# EAGLE design ce_cart (EAGLE 6.2)
Assembly variants: ACSI, SCSI
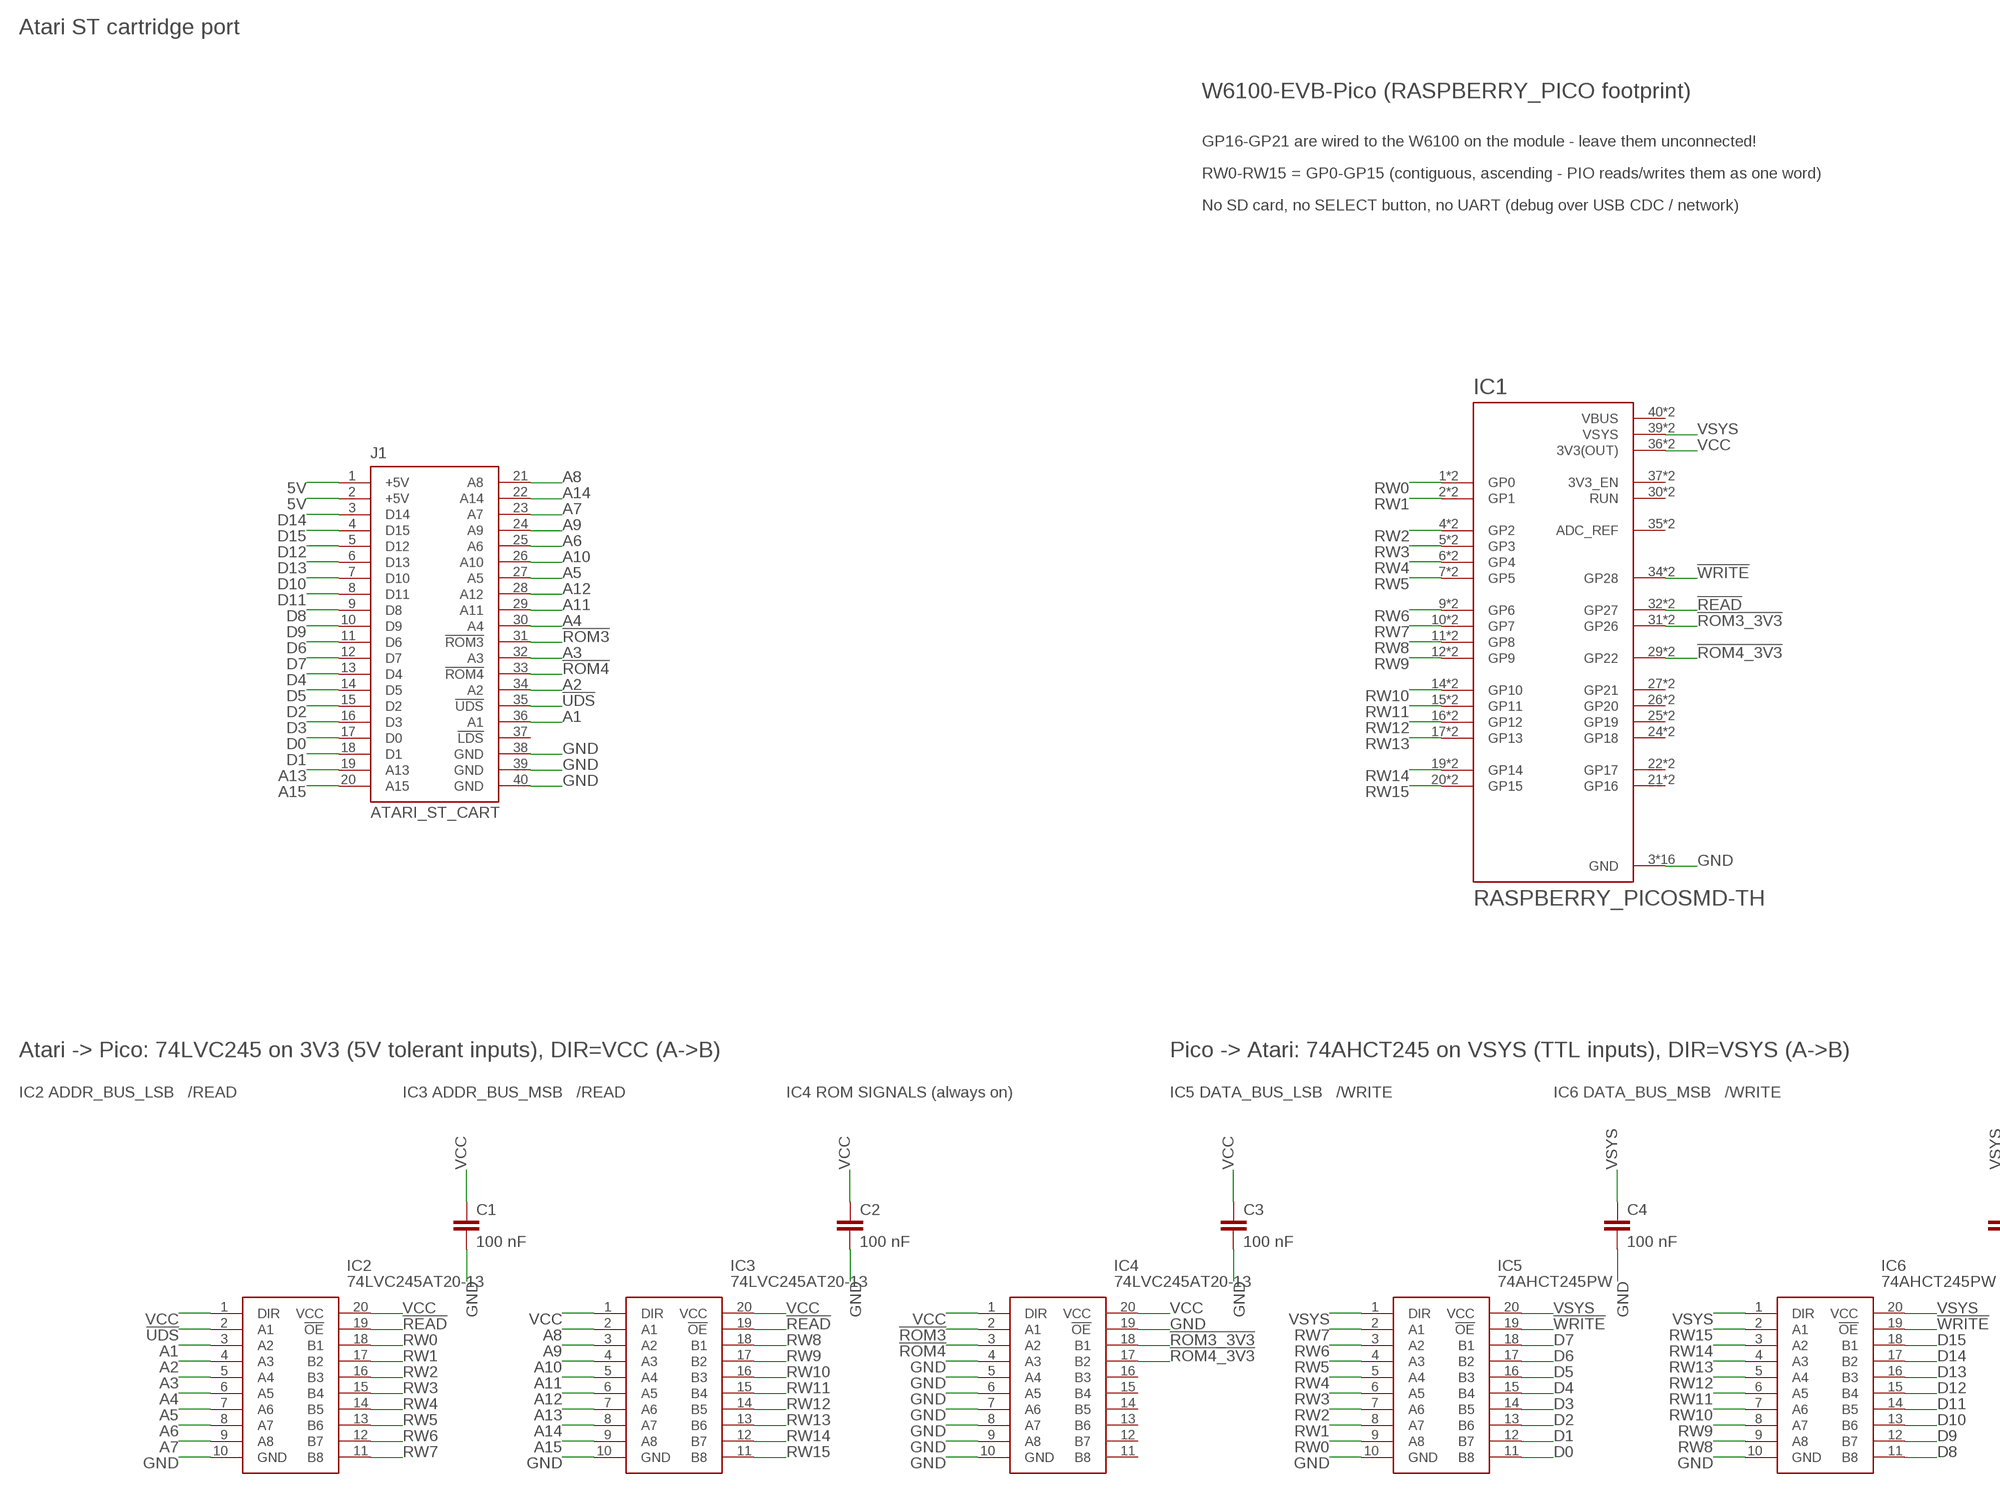
[diagram p0: schematic, sheet 1, part 1 of 2]
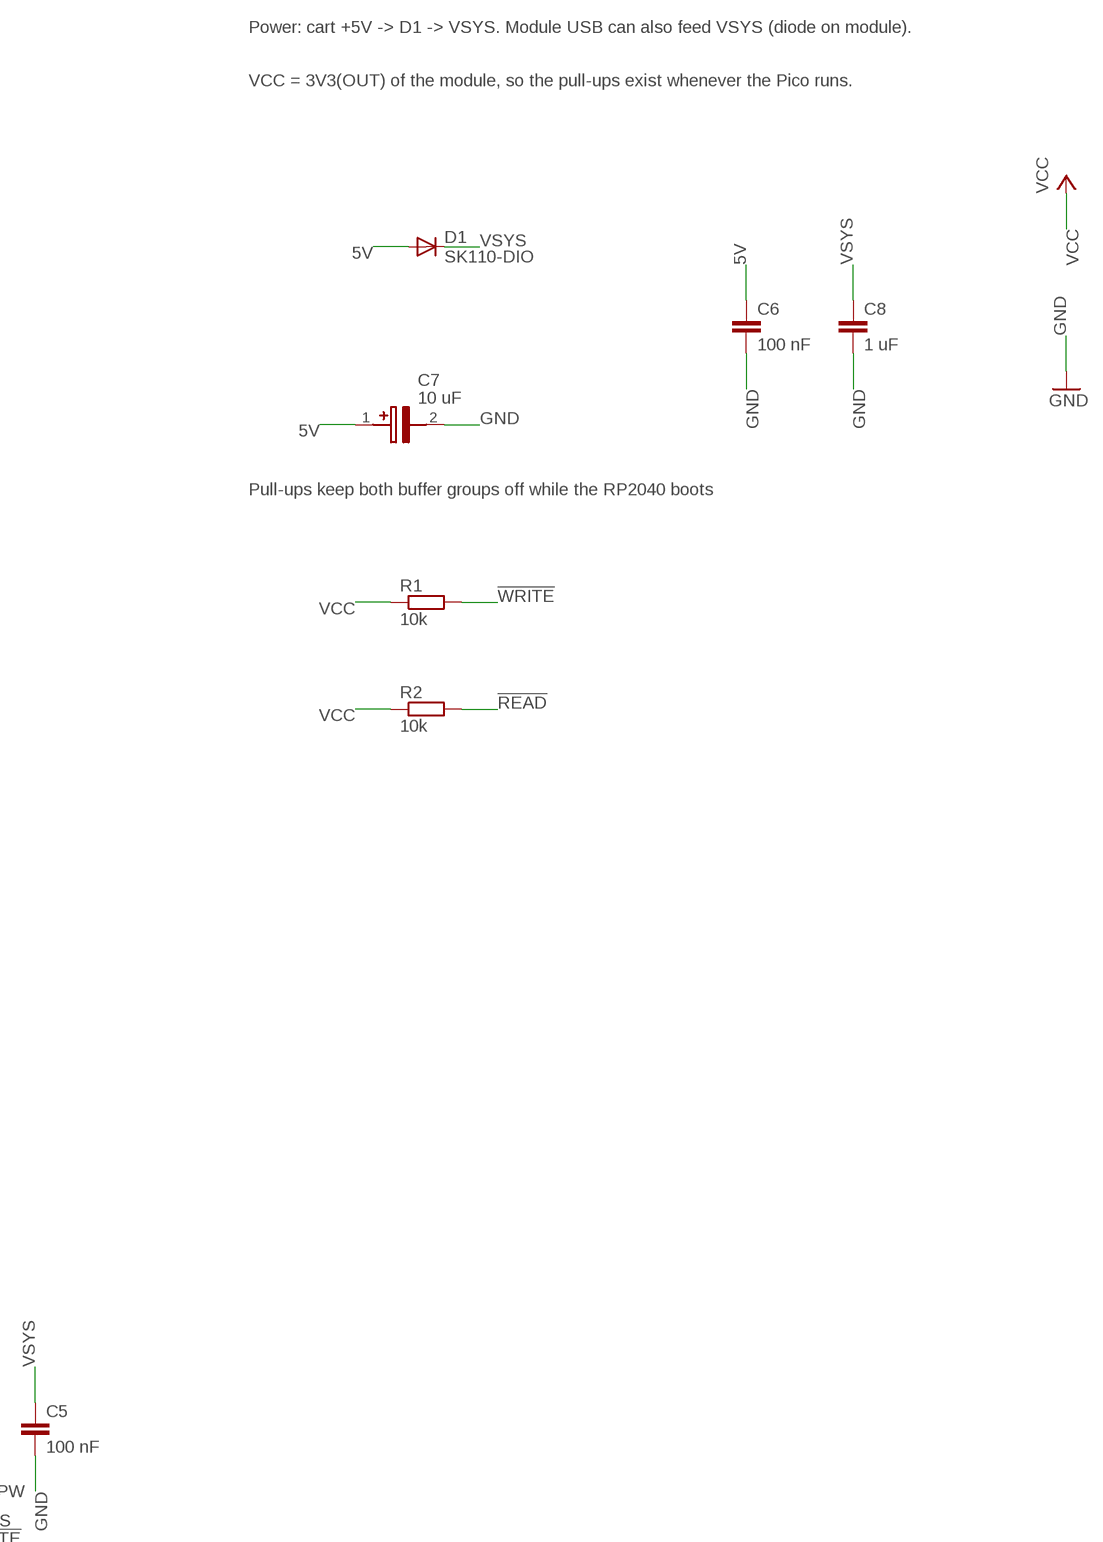
[diagram p1: schematic, sheet 1, part 2 of 2]

## Parts
C1  100 nF  C-EUC0603  [C0603]
C2  100 nF  C-EUC0603  [C0603]
C3  100 nF  C-EUC0603  [C0603]
C4  100 nF  C-EUC0603  [C0603]
C5  100 nF  C-EUC0603  [C0603]
C6  100 nF  C-EUC0603  [C0603]
C7  10 uF  293D106X9016B2TE3  [CAPPM3528X210N]
C8  1 uF  C-EUC0603  [C0603]
D1  SK110-DIO  DIODE-DO214AC  [DO214AC]
IC1  RASPBERRY_PICOSMD-TH  [PICO-PKG]
IC2  74LVC245AT20-13  [SOP65P640X120-20N]
IC3  74LVC245AT20-13  [SOP65P640X120-20N]
IC4  74LVC245AT20-13  [SOP65P640X120-20N]
IC5  74AHCT245PW  [SOP65P640X120-20N]
IC6  74AHCT245PW  [SOP65P640X120-20N]
J1  ATARI_ST_CART  ST_CART  [ST_CART_EDGE_2X20]
R1  10k  R-EU_R0603  [R0603]
R2  10k  R-EU_R0603  [R0603]

## Nets
5V: C6.1 C7.1(+) D1.A J1.1(+5V) J1.2(+5V)
!READ: IC1.32(GP27) IC1.P$32(GP27) IC2.19(!OE) IC3.19(!OE) R2.2
!ROM3: IC4.2(A1) J1.31(!ROM3)
!ROM3_3V3: IC1.31(GP26) IC1.P$31(GP26) IC4.18(B1)
!ROM4: IC4.3(A2) J1.33(!ROM4)
!ROM4_3V3: IC1.29(GP22) IC1.P$29(GP22) IC4.17(B2)
!UDS: IC2.2(A1) J1.35(!UDS)
!WRITE: IC1.34(GP28) IC1.P$34(GP28) IC5.19(!OE) IC6.19(!OE) R1.2
A1: IC2.3(A2) J1.36(A1)
A2: IC2.4(A3) J1.34(A2)
A3: IC2.5(A4) J1.32(A3)
A4: IC2.6(A5) J1.30(A4)
A5: IC2.7(A6) J1.27(A5)
A6: IC2.8(A7) J1.25(A6)
A7: IC2.9(A8) J1.23(A7)
A8: IC3.2(A1) J1.21(A8)
A9: IC3.3(A2) J1.24(A9)
A10: IC3.4(A3) J1.26(A10)
A11: IC3.5(A4) J1.29(A11)
A12: IC3.6(A5) J1.28(A12)
A13: IC3.7(A6) J1.19(A13)
A14: IC3.8(A7) J1.22(A14)
A15: IC3.9(A8) J1.20(A15)
D0: IC5.11(B8) J1.17(D0)
D1: IC5.12(B7) J1.18(D1)
D2: IC5.13(B6) J1.15(D2)
D3: IC5.14(B5) J1.16(D3)
D4: IC5.15(B4) J1.13(D4)
D5: IC5.16(B3) J1.14(D5)
D6: IC5.17(B2) J1.11(D6)
D7: IC5.18(B1) J1.12(D7)
D8: IC6.11(B8) J1.9(D8)
D9: IC6.12(B7) J1.10(D9)
D10: IC6.13(B6) J1.7(D10)
D11: IC6.14(B5) J1.8(D11)
D12: IC6.15(B4) J1.5(D12)
D13: IC6.16(B3) J1.6(D13)
D14: IC6.17(B2) J1.3(D14)
D15: IC6.18(B1) J1.4(D15)
GND: C1.2 C2.2 C3.2 C4.2 C5.2 C6.2 C7.2(-) C8.2 IC1.3(GND) IC1.8(GND) IC1.13(GND) IC1.18(GND) IC1.23(GND) IC1.28(GND) IC1.33(GND) IC1.38(GND) IC1.P$3(GND) IC1.P$8(GND) IC1.P$13(GND) IC1.P$18(GND) IC1.P$23(GND) IC1.P$28(GND) IC1.P$33(GND) IC1.P$38(GND) IC2.10(GND) IC3.10(GND) IC4.4(A3) IC4.5(A4) IC4.6(A5) IC4.7(A6) IC4.8(A7) IC4.9(A8) IC4.10(GND) IC4.19(!OE) IC5.10(GND) IC6.10(GND) J1.38(GND) J1.39(GND) J1.40(GND)
RW0: IC1.1(GP0) IC1.P$1(GP0) IC2.18(B1) IC5.9(A8)
RW1: IC1.2(GP1) IC1.P$2(GP1) IC2.17(B2) IC5.8(A7)
RW2: IC1.4(GP2) IC1.P$4(GP2) IC2.16(B3) IC5.7(A6)
RW3: IC1.5(GP3) IC1.P$5(GP3) IC2.15(B4) IC5.6(A5)
RW4: IC1.6(GP4) IC1.P$6(GP4) IC2.14(B5) IC5.5(A4)
RW5: IC1.7(GP5) IC1.P$7(GP5) IC2.13(B6) IC5.4(A3)
RW6: IC1.9(GP6) IC1.P$9(GP6) IC2.12(B7) IC5.3(A2)
RW7: IC1.10(GP7) IC1.P$10(GP7) IC2.11(B8) IC5.2(A1)
RW8: IC1.11(GP8) IC1.P$11(GP8) IC3.18(B1) IC6.9(A8)
RW9: IC1.12(GP9) IC1.P$12(GP9) IC3.17(B2) IC6.8(A7)
RW10: IC1.14(GP10) IC1.P$14(GP10) IC3.16(B3) IC6.7(A6)
RW11: IC1.15(GP11) IC1.P$15(GP11) IC3.15(B4) IC6.6(A5)
RW12: IC1.16(GP12) IC1.P$16(GP12) IC3.14(B5) IC6.5(A4)
RW13: IC1.17(GP13) IC1.P$17(GP13) IC3.13(B6) IC6.4(A3)
RW14: IC1.19(GP14) IC1.P$19(GP14) IC3.12(B7) IC6.3(A2)
RW15: IC1.20(GP15) IC1.P$20(GP15) IC3.11(B8) IC6.2(A1)
VCC: C1.1 C2.1 C3.1 IC1.36(3V3(OUT)) IC1.P$36(3V3(OUT)) IC2.1(DIR) IC2.20(VCC) IC3.1(DIR) IC3.20(VCC) IC4.1(DIR) IC4.20(VCC) R1.1 R2.1
VSYS: C4.1 C5.1 C8.1 D1.C IC1.39(VSYS) IC1.P$39(VSYS) IC5.1(DIR) IC5.20(VCC) IC6.1(DIR) IC6.20(VCC)
Unconnected: IC1.21(GP16) IC1.22(GP17) IC1.24(GP18) IC1.25(GP19) IC1.26(GP20) IC1.27(GP21) IC1.30(RUN) IC1.35(ADC_REF) IC1.37(3V3_EN) IC1.P$21(GP16) IC1.P$22(GP17) IC1.P$24(GP18) IC1.P$25(GP19) IC1.P$26(GP20) IC1.P$27(GP21) IC1.P$30(RUN) IC1.P$35(ADC_REF) IC1.P$37(3V3_EN) IC4.11(B8) IC4.12(B7) IC4.13(B6) IC4.14(B5) IC4.15(B4) IC4.16(B3) J1.37(!LDS)

## Notes on the sheet
- CE ROM port board - SidecarT-style shared bus, W6100-EVB-Pico | Power: cart +5V -> D1 -> VSYS. Module USB can also feed VSYS (diode on module).
- VCC = 3V3(OUT) of the module, so the pull-ups exist whenever the Pico runs.
- Atari ST cartridge port
- W6100-EVB-Pico (RASPBERRY_PICO footprint)
- GP16-GP21 are wired to the W6100 on the module - leave them unconnected!
- RW0-RW15 = GP0-GP15 (contiguous, ascending - PIO reads/writes them as one word)
- No SD card, no SELECT button, no UART (debug over USB CDC / network)
- Pull-ups keep both buffer groups off while the RP2040 boots
- Atari -> Pico: 74LVC245 on 3V3 (5V tolerant inputs), DIR=VCC (A->B) | Pico -> Atari: 74AHCT245 on VSYS (TTL inputs), DIR=VSYS (A->B)
- IC2 ADDR_BUS_LSB   /READ | IC3 ADDR_BUS_MSB   /READ | IC4 ROM SIGNALS (always on) | IC5 DATA_BUS_LSB   /WRITE | IC6 DATA_BUS_MSB   /WRITE

## Power pins joined to a net without a drawn wire
VBUS: IC1.40(VBUS) IC1.P$40(VBUS)

## Library data of the parts
C1-C6 C8 = rcl:C-EU: CAPACITOR, European symbol
C7 = 293D106X9016B2TE3:293D106X9016B2TE3: Solid Tantalum Surface Mount Chip Capacitors TANTAMOUNT(TM), Molded Case, Standard Industrial Grade Source: Datasheet <http://www.vishay.com/docs/40002/293d.pdf>; DESCRIPTION: Solid Tantalum Surface Mount Chip Capacitors TANTAMOUNT(TM), Molded Case, Standard Industrial Grade; HEIGHT: 2.1mm; MANUFACTURER_NAME: Vishay; MANUFACTURER_PART_NUMBER: 293D106X9016B2TE3
D1 = diode:DIODE-: DIODE
IC1 = RpiPico:RASPBERRY_PICO: Raspberry Pi Pico
IC2-IC4 = 74LVC245AT20-13:74LVC245AT20-13: Bus Transceivers Octal Buffer Trans 3-State Outputs Source: Datasheet <https://www.diodes.com/assets/Datasheets/74LVC245A.pdf>; DESCRIPTION: Bus Transceivers Octal Buffer Trans 3-State Outputs; HEIGHT: 1.2mm; MANUFACTURER_NAME: Diodes Incorporated; MANUFACTURER_PART_NUMBER: 74LVC245AT20-13
IC5 IC6 = ce_cart:74AHCT245PW: 74AHCT245PW (Nexperia) / SN74AHCT245PWR (TI), TSSOP-20 - TTL-level inputs, 5V outputs; DESCRIPTION: Bus Transceivers Octal Buffer Trans 3-State Outputs; HEIGHT: 1.2mm; MANUFACTURER_NAME: Diodes Incorporated; MANUFACTURER_PART_NUMBER: 74LVC245AT20-13
J1 = ce_cart:ST_CART: Atari ST cartridge port (ROM port) - card edge
R1 R2 = rcl:R-EU_: RESISTOR, European symbol

## Board
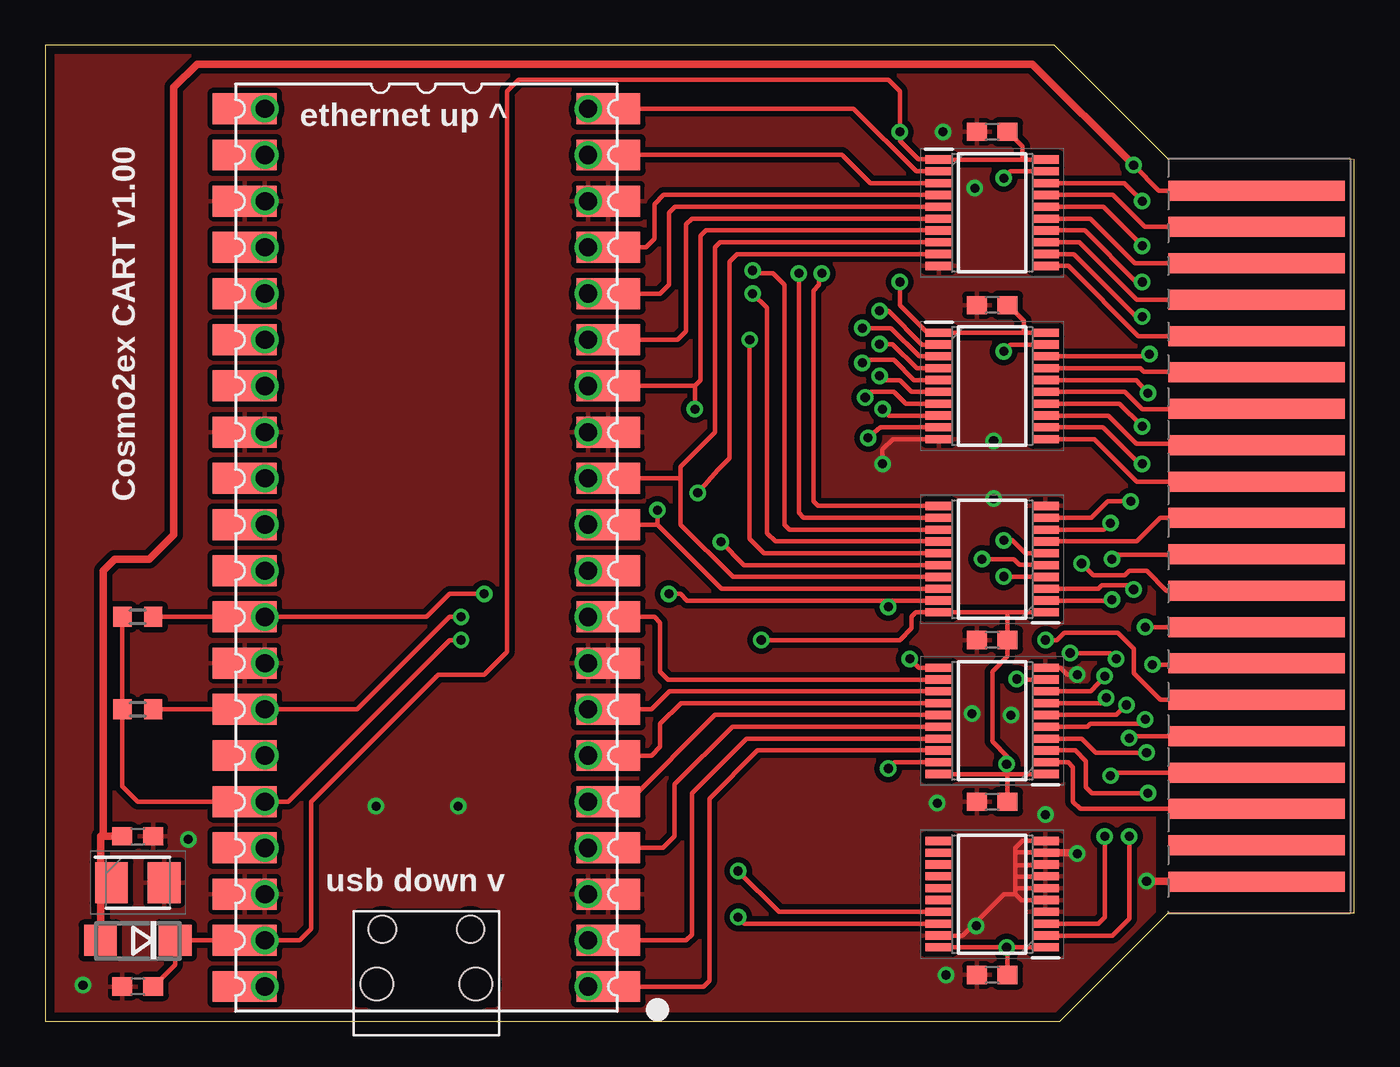
[diagram p2: board, top side]
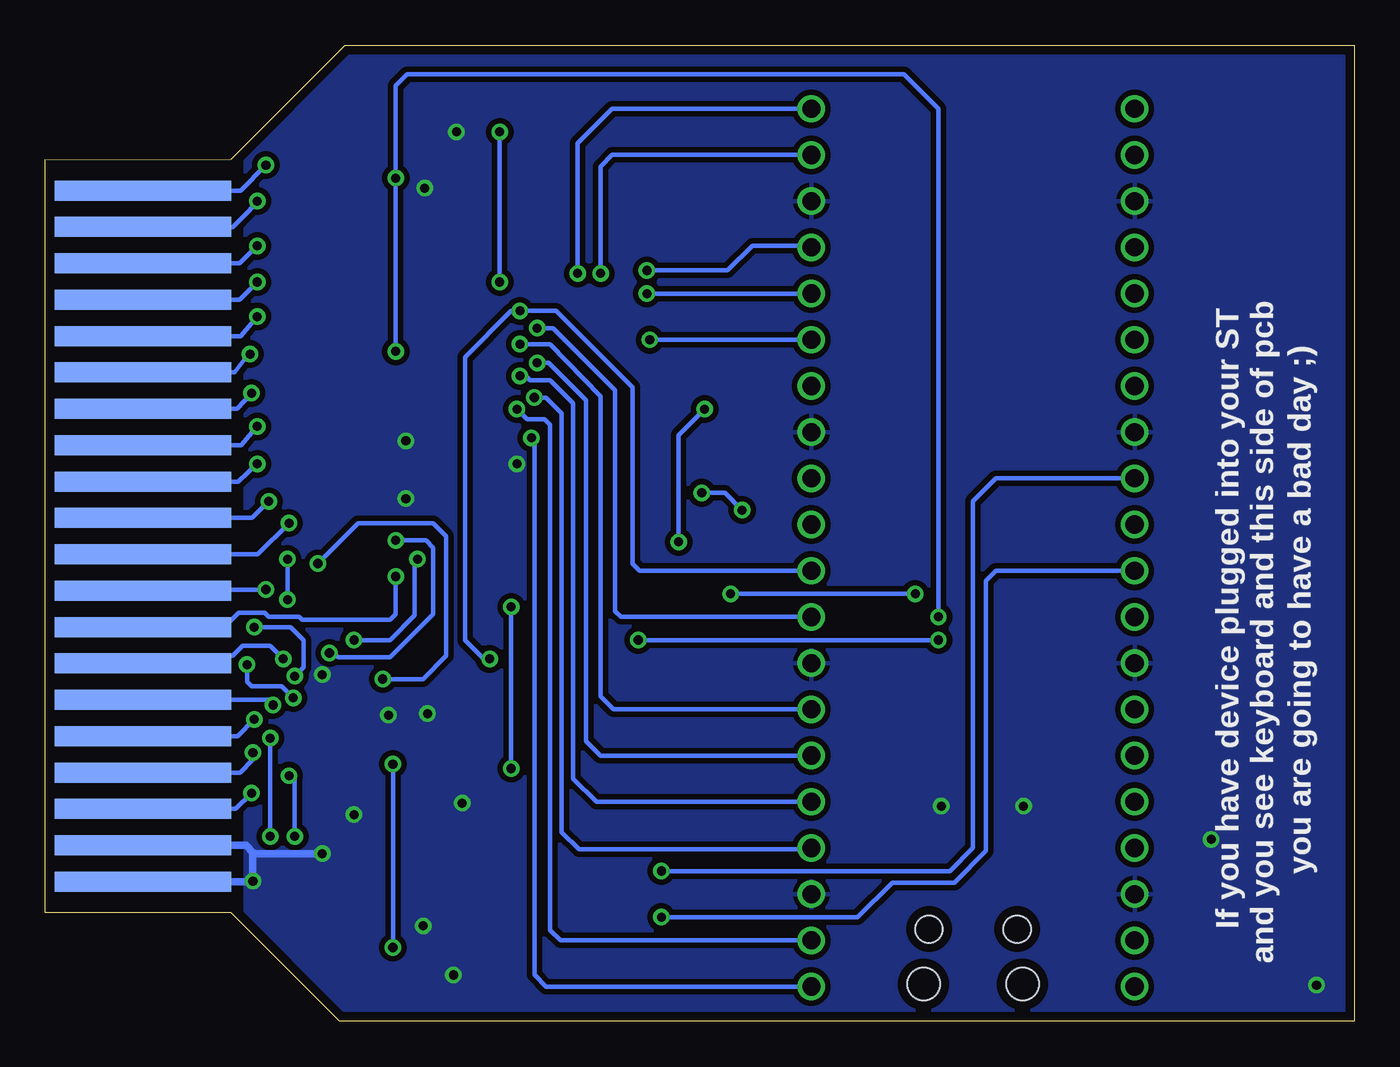
[diagram p3: board, bottom side, seen from below]

Size 71.97 x 53.65 mm. Coordinates in mm from the lower left corner, seen from the top.
Outline: 0,0 55.8,0 61.75,5.95 71.97,5.95 71.97,47.37 61.75,47.39 55.5,53.65 0,53.65 0,0
Copper layers (1*16): Top 0.035mm / dielectric 1.5mm / Bottom 0.035mm
Design rules: minimum track width 0.25mm, minimum drill 0.4mm, track to track 0.2mm, track to pad 0.2mm, pad to pad 0.2mm, via to via 0.2mm, smd to smd 0.2mm, copper to edge 0.5mm, drill to drill 8mil, minimum pad ring 10mil, minimum via ring 8mil, stop-mask expansion 4mil, vias tented up to drill 0mil, thermal gap 10mil

### Footprints (pad centres in the part's own frame; a part is rotated, then mirrored left to right if it is on the bottom)
C0603 = smd 1.1 x 1: 1 -0.85,0; 2 0.85,0
CAPPM3528X210N = smd 1.8 x 2.25: 1 -1.45,0; 2 1.45,0
DO214AC = smd 1.8 x 1.7: A 2.05,0; C -2.05,0
PICO-PKG = drill 1: 1 -8.89,24.13; 2 -8.89,21.59; 3 -8.89,19.05; 4 -8.89,16.51; 5 -8.89,13.97; 6 -8.89,11.43; 7 -8.89,8.89; 8 -8.89,6.35; 9 -8.89,3.81; 10 -8.89,1.27; 11 -8.89,-1.27; 12 -8.89,-3.81; 13 -8.89,-6.35; 14 -8.89,-8.89; 15 -8.89,-11.43; 16 -8.89,-13.97; 17 -8.89,-16.51; 18 -8.89,-19.05; 19 -8.89,-21.59; 20 -8.89,-24.13; 21 8.89,-24.13; 22 8.89,-21.59; 23 8.89,-19.05; 24 8.89,-16.51; 25 8.89,-13.97; 26 8.89,-11.43; 27 8.89,-8.89; 28 8.89,-6.35; 29 8.89,-3.81; 30 8.89,-1.27; 31 8.89,1.27; 32 8.89,3.81; 33 8.89,6.35; 34 8.89,8.89; 35 8.89,11.43; 36 8.89,13.97; 37 8.89,16.51; 38 8.89,19.05; 39 8.89,21.59; 40 8.89,24.13 | smd 3.5 x 1.7: P$1 -10,24.13; P$2 -10,21.59; P$3 -10,19.05; P$4 -10,16.51; P$5 -10,13.97; P$6 -10,11.43; P$7 -10,8.89; P$8 -10,6.35; P$9 -10,3.81; P$10 -10,1.27; P$11 -10,-1.27; P$12 -10,-3.81; P$13 -10,-6.35; P$14 -10,-8.89; P$15 -10,-11.43; P$16 -10,-13.97; P$17 -10,-16.51; P$18 -10,-19.05; P$19 -10,-21.59; P$20 -10,-24.13; P$21 10,-24.13; P$22 10,-21.59; P$23 10,-19.05; P$24 10,-16.51; P$25 10,-13.97; P$26 10,-11.43; P$27 10,-8.89; P$28 10,-6.35; P$29 10,-3.81; P$30 10,-1.27; P$31 10,1.27; P$32 10,3.81; P$33 10,6.35; P$34 10,8.89; P$35 10,11.43; P$36 10,13.97; P$37 10,16.51; P$38 10,19.05; P$39 10,21.59; P$40 10,24.13 | hole 1.8: -2.725,24; 2.725,24 | hole 1.5: -2.425,20.97; 2.425,20.97
SOP65P640X120-20N = smd 1.475 x 0.45: 1 -2.938,2.925; 2 -2.938,2.275; 3 -2.938,1.625; 4 -2.938,0.975; 5 -2.938,0.325; 6 -2.938,-0.325; 7 -2.938,-0.975; 8 -2.938,-1.625; 9 -2.938,-2.275; 10 -2.938,-2.925; 11 2.938,-2.925; 12 2.938,-2.275; 13 2.938,-1.625; 14 2.938,-0.975; 15 2.938,-0.325; 16 2.938,0.325; 17 2.938,0.975; 18 2.938,1.625; 19 2.938,2.275; 20 2.938,2.925
ST_CART_EDGE_2X20 = smd 1.1 x 9.7: 1 -19,-5.15; 3 -17,-5.15; 5 -15,-5.15; 7 -13,-5.15; 9 -11,-5.15; 11 -9,-5.15; 13 -7,-5.15; 15 -5,-5.15; 17 -3,-5.15; 19 -1,-5.15; 21 1,-5.15; 23 3,-5.15; 25 5,-5.15; 27 7,-5.15; 29 9,-5.15; 31 11,-5.15; 33 13,-5.15; 35 15,-5.15; 37 17,-5.15; 39 19,-5.15 | smd 1.1 x 9.7 bottom: 2 -19,-5.15; 4 -17,-5.15; 6 -15,-5.15; 8 -13,-5.15; 10 -11,-5.15; 12 -9,-5.15; 14 -7,-5.15; 16 -5,-5.15; 18 -3,-5.15; 20 -1,-5.15; 22 1,-5.15; 24 3,-5.15; 26 5,-5.15; 28 7,-5.15; 30 9,-5.15; 32 11,-5.15; 34 13,-5.15; 36 15,-5.15; 38 17,-5.15; 40 19,-5.15
R0603 = smd 1 x 1.1: 1 -0.85,0; 2 0.85,0

### Placement (x,y rotation side)
C1  52.07,20.96 180 top
C2  52.07,12.07 180 top
C3  52.07,2.54 180 top
C4  52.07,39.37 180 top
C5  52.07,48.9 180 top
C6  5.08,10.16 0 top
C7  5.08,7.62 0 top
C8  5.08,1.91 180 top
D1  5.08,4.45 180 top
IC1  20.95,26.04 180 top
IC2  52.07,16.51 180 top
IC3  52.07,25.4 180 top
IC4  52.07,6.98 180 top
IC5  52.07,34.93 0 top
IC6  52.07,44.45 0 top
J1  71.76,26.67 270 top
R1  5.08,17.15 0 top
R2  5.08,22.23 0 top

### Tracks (layer width: path | path; a pad name or v marks a point on that pad's centre or on a via)
5V  (via drill 0.5)
  Top 0.254: 3.17,10.16 3.03,10.16 | C7.1 3.03,7.62 | v59.85,47.07 61.25,45.67 J1.2
  Top 0.406: C6.1 3.17,10.16 3.17,24.77 3.81,25.4 5.71,25.4 7.06,26.75 7.06,51.36 8.33,52.63 54.29,52.63 v59.85,47.07 | 3.03,10.16 3.03,7.62 D1.A
  Bottom 0.254: J1.2 61.25,45.67 v59.85,47.07
!READ  (via drill 0.5)
  Top 0.254: IC3.19 46.36,23.12 | 46.36,23.12 35.3,23.12 34.92,23.5 v34.29,23.5 | IC2.19 46.7,14.23 v46.36,13.89 | v46.36,22.78 46.36,23.12 | v24.13,23.5 22.23,23.5 20.95,22.23 IC1.32 IC1.P$32 R2.2
  Bottom 0.254: v46.36,13.89 v46.36,22.78 | v24.13,23.5 v34.29,23.5
!ROM3  (via drill 0.5)
  Top 0.254: IC4.2 58.69,4.71 59.61,5.64 v59.61,10.16 | v59.61,15.56 59.74,15.67 J1.31
  Bottom 0.254: v59.61,10.16 v59.61,15.56
!ROM3_3V3  (via drill 0.5)
  Top 0.254: IC1.P$31 IC1.31 | IC4.18 38.45,5.36 v38.1,5.72
  Bottom 0.254: v38.1,5.72 27.3,5.72 25.4,7.62 21.99,7.62 20.24,9.37 20.24,24.21 19.69,24.77 IC1.31
!ROM4  (via drill 0.5)
  Top 0.254: IC4.3 57.91,5.36 58.26,5.72 v58.26,10.16 | v58.58,13.49 58.68,13.67 J1.33
  Bottom 0.254: v58.26,10.16 58.26,13.34 v58.58,13.49
!ROM4_3V3  (via drill 0.5)
  Top 0.254: IC1.P$29 IC1.29 | IC4.17 40.34,6.01 v38.1,8.26
  Bottom 0.254: v38.1,8.26 22.23,8.26 20.95,9.52 20.95,28.58 19.69,29.84 IC1.29
!UDS
  Top 0.254: IC2.2 56.25,14.23 56.52,13.97 56.52,12.07 56.91,11.67 J1.35
!WRITE  (via drill 0.5)
  Top 0.254: IC5.19 53.08,37.2 v52.7,36.83 | v52.7,46.35 53.08,46.73 IC6.19 | v22.86,22.23 22.23,22.23 17.14,17.15 IC1.34 IC1.P$34 R1.2
  Bottom 0.254: v52.7,36.83 v52.7,46.35 52.7,51.43 52.07,52.07 24.77,52.07 22.86,50.16 v22.86,22.23
A1  (via drill 0.5)
  Top 0.254: IC2.3 56.63,14.89 57.23,14.29 57.23,12.86 57.55,12.54 v60.64,12.54
  Bottom 0.254: v60.64,12.54 61.51,11.67 J1.36
A2  (via drill 0.5)
  Top 0.254: IC2.4 57.01,15.54 57.78,14.76 v60.56,14.76
  Bottom 0.254: v60.56,14.76 60.56,14.37 61.28,13.65 66.59,13.65 J1.34
A3  (via drill 0.5)
  Top 0.254: IC2.5 57.3,16.19 57.47,16.35 60.25,16.35 v60.48,16.59
  Bottom 0.254: v60.48,16.59 61.4,15.67 J1.32
A4  (via drill 0.5)
  Top 0.254: IC2.6 58.9,16.84 v59.45,17.38
  Bottom 0.254: v59.45,17.38 59.74,17.67 J1.30
A5  (via drill 0.5)
  Top 0.254: IC2.7 58.05,17.48 v58.34,17.78 | v60.88,19.61 66.54,19.61 J1.27
  Bottom 0.254: v58.34,17.78 58.98,18.41 60.64,18.41 60.88,18.65 v60.88,19.61
A6  (via drill 0.5)
  Top 0.254: IC2.8 57.5,18.14 v58.26,18.97 | v60.48,21.67 60.41,21.67 J1.25
  Bottom 0.254: v60.48,21.67 58.5,21.67 57.78,20.96 57.78,19.45 v58.26,18.97
A7  (via drill 0.5)
  Top 0.254: J1.23 61.66,23.67 60.56,24.77 59.61,24.77 59.37,24.53 57.63,24.53 v56.99,25.16 | v53.42,18.81 53.45,18.79 IC2.9
  Bottom 0.254: v56.99,25.16 54.77,27.38 50.64,27.38 49.93,26.67 49.93,20.08 51.2,18.81 v53.42,18.81
A8  (via drill 0.5)
  Top 0.254: IC3.2 58.61,23.12 v58.66,23.18 | J1.21 66.57,25.64 58.9,25.64 v58.66,25.4
  Bottom 0.254: v58.66,23.18 v58.66,25.4
A9  (via drill 0.5)
  Top 0.254: IC3.3 57.91,23.77 58.1,23.97 59.61,23.97 v59.85,23.73
  Bottom 0.254: v59.85,23.73 66.54,23.73 J1.24
A10  (via drill 0.5)
  Top 0.254: IC3.4 52.73,24.43 v52.7,24.45
  Bottom 0.254: v52.7,24.45 52.7,22.38 53.02,22.07 57.86,22.07 58.02,22.23 59.69,22.23 59.93,22.46 61.36,22.46 62.15,21.67 J1.26
A11  (via drill 0.5)
  Top 0.254: 66.5,17.78 J1.29 61.31,17.67 59.85,19.13 59.85,20.48 58.98,21.35 56.04,21.35 55.64,20.96 v55.01,20.96 | v51.51,25.4 53.26,25.4 53.58,25.08 IC3.5
  Bottom 0.254: v55.01,20.96 53.02,20.96 51.67,22.3 51.67,25.24 v51.51,25.4
A12  (via drill 0.5)
  Top 0.254: IC3.6 53.89,25.73 53.18,26.43 v52.7,26.43 | v56.36,20.24 58.58,20.24 v58.9,19.92
  Bottom 0.254: v52.7,26.43 51.04,26.43 50.64,26.04 50.64,22.38 53.02,20 55.88,20 56.12,20.24 v56.36,20.24 | v58.9,19.92 59.61,20.64 61.12,20.64 61.67,20.08 66.19,20.08 J1.28
A13
  Top 0.254: IC3.7 60.03,26.38 61.33,27.67 J1.19
A14  (via drill 0.5)
  Top 0.254: IC3.8 58.22,27.02 v58.58,27.38
  Bottom 0.254: v58.58,27.38 60.29,25.67 J1.22
A15  (via drill 0.5)
  Top 0.254: IC3.9 57.52,27.68 58.42,28.58 v59.69,28.58
  Bottom 0.254: v59.69,28.58 60.59,27.67 J1.20
D0
  Top 0.254: IC5.11 57.69,32 60.02,29.67 J1.17
D1  (via drill 0.5)
  Top 0.254: IC5.12 58.16,32.65 60.17,30.64 v60.33,30.64
  Bottom 0.254: v60.33,30.64 61.37,29.67 J1.18
D2
  Top 0.254: IC5.13 58.46,33.3 60.01,31.75 66.53,31.75 J1.15
D3  (via drill 0.5)
  Top 0.254: IC5.14 59.08,33.95 v60.33,32.7
  Bottom 0.254: v60.33,32.7 61.2,31.67 J1.16
D4
  Top 0.254: IC5.15 59.38,34.6 60.33,33.66 66.59,33.66 J1.13
D5  (via drill 0.5)
  Top 0.254: IC5.16 60,35.25 v60.64,34.53
  Bottom 0.254: v60.64,34.53 61.42,33.67 J1.14
D6
  Top 0.254: IC5.17 60.22,35.9 60.4,35.72 66.56,35.72 J1.11
D7  (via drill 0.5)
  Top 0.254: IC5.18 60.68,36.55 v60.72,36.67
  Bottom 0.254: J1.12 61.56,35.67 60.85,36.62 v60.72,36.67
D8
  Top 0.254: IC6.11 56.27,41.52 60.12,37.67 J1.9
D9  (via drill 0.5)
  Top 0.254: IC6.12 56.57,42.18 60.01,38.74 v60.33,38.74
  Bottom 0.254: v60.33,38.74 61.23,37.67 J1.10
D10
  Top 0.254: IC6.13 56.87,42.82 60.03,39.67 J1.7
D11  (via drill 0.5)
  Top 0.254: IC6.14 57.17,43.48 60.01,40.64 v60.33,40.64
  Bottom 0.254: v60.33,40.64 61.3,39.67 J1.8
D12
  Top 0.254: IC6.15 57.47,44.13 59.93,41.67 J1.5
D13  (via drill 0.5)
  Top 0.254: IC6.16 58.17,44.77 v60.33,42.62
  Bottom 0.254: v60.33,42.62 61.28,41.67 J1.6
D14
  Top 0.254: IC6.17 58.72,45.43 60.47,43.67 J1.3
D15  (via drill 0.5)
  Top 0.254: IC6.18 59.33,46.07 v60.33,45.09
  Bottom 0.254: v60.33,45.09 60.8,44.53 61.67,43.66 66.59,43.66 J1.4
GND  (via drill 0.5)
  Top 0.254: IC5.10 46.61,32 46.04,31.43 v46.04,30.64 | IC1.P$23 IC1.23 | IC1.P$28 IC1.28 | IC1.P$33 IC1.33 | IC1.P$38 IC1.38 | IC1.3 IC1.P$3 | IC1.P$8 IC1.8 | IC1.P$13 IC1.13 | IC1.P$18 IC1.18 | IC4.19 50.43,4.71 52.7,6.98 53.34,6.98 | IC4.10 53.72,9.91 53.34,9.52 53.34,9.29 | 53.34,9.29 53.34,8.57 | 53.34,8.57 53.34,7.94 | 53.34,7.94 53.34,7.3 | 53.34,7.3 53.34,6.98 | 53.34,6.98 53.67,6.66 IC4.5 | IC4.6 55,7.3 53.34,7.3 | IC4.7 54.98,7.94 53.34,7.94 | IC4.8 54.97,8.57 53.34,8.57 | IC4.9 54.98,9.29 53.34,9.29 | IC2.10 55.81,19.44 56.2,19.05 v56.75,19.05
  Top 0.406: v60.56,7.7 66.58,7.7 J1.40 | IC4.9 56.7,9.26 v56.75,9.21
  Bottom 0.406: J1.38 60.95,9.67 60.56,9.29 | 60.56,9.29 v60.56,7.7 60.59,7.67 J1.40 | v56.75,9.21 60.48,9.21 60.56,9.29
  other vias: 50.96,16.91 53.1,16.83 49.05,11.99 52.15,28.73 52.15,31.91 51.12,45.8 49.37,48.9 7.86,10 2.06,1.98 18.18,11.83 22.7,11.83 51.2,5.24 55.01,11.35 49.53,2.54
  pour Bottom (isolate 0.305): 0,53.98 60.96,53.98 60.96,0 0,0
  pour Top (isolate 0.305): 0,53.98 60.96,53.98 60.96,0 0,0
RW0  (via drill 0.5)
  Top 0.254: IC2.18 39.17,14.89 36.51,12.22 36.51,2.22 36.2,1.91 IC1.P$1 IC1.1 | IC5.9 45.93,32.65 v45.24,32.07
  Bottom 0.254: v45.24,32.07 45.08,31.91 45.08,2.54 44.45,1.91 IC1.1
RW1  (via drill 0.5)
  Top 0.254: IC2.17 38.55,15.54 35.56,12.54 35.56,4.76 35.24,4.45 IC1.P$2 IC1.2 | IC5.8 46.39,33.3 v46.04,33.66
  Bottom 0.254: v46.04,33.66 45.48,33.1 44.53,33.1 44.21,32.78 44.21,5 43.66,4.45 IC1.2
RW2  (via drill 0.5)
  Top 0.254: IC2.16 37.78,16.19 34.61,13.02 34.61,10.16 33.97,9.52 IC1.P$4 IC1.4 | IC5.7 47.33,33.95 46.67,34.61 45.4,34.61 v45.08,34.29
  Bottom 0.254: v45.08,34.29 44.45,34.29 43.58,33.42 43.58,10.4 42.62,9.45 29.92,9.45 IC1.4
RW3  (via drill 0.5)
  Top 0.254: IC2.15 36.84,16.84 32.07,12.07 IC1.P$5 IC1.5 | IC5.6 47.63,34.6 46.99,35.24 46.2,35.24 v45.88,35.48
  Bottom 0.254: v45.88,35.48 45.56,35.48 45.32,35.24 44.21,35.24 42.94,33.97 42.94,13.34 41.67,12.07 IC1.5
RW4  (via drill 0.5)
  Top 0.254: IC2.14 34.95,17.48 33.81,16.35 33.81,15.08 33.34,14.61 IC1.P$6 IC1.6 | IC5.5 47.78,35.25 46.67,36.35 45.08,36.35 v44.93,36.2
  Bottom 0.254: v44.93,36.2 44.29,36.2 42.23,34.13 42.23,15.4 41.43,14.61 IC1.6
RW5  (via drill 0.5)
  Top 0.254: IC2.13 34.33,18.14 33.34,17.15 IC1.P$7 IC1.7 | IC5.4 47.92,35.9 46.59,37.23 v45.88,37.23
  Bottom 0.254: v45.88,37.23 44.21,37.23 41.43,34.37 41.43,17.86 40.72,17.15 IC1.7
RW6  (via drill 0.5)
  Top 0.254: IC2.12 34.24,18.79 33.81,19.21 33.81,21.91 33.5,22.23 IC1.P$9 IC1.9 | IC5.3 48.06,36.55 46.51,38.1 v44.93,38.1
  Bottom 0.254: v44.93,38.1 44.05,38.1 40.64,34.69 40.64,22.54 40.32,22.23 IC1.9
RW7  (via drill 0.5)
  Top 0.254: IC5.2 48.21,37.2 46.36,39.05 v45.88,39.05 | IC1.P$10 IC1.10 | IC2.11 48.03,19.44 v47.55,19.92
  Bottom 0.254: IC1.10 39.29,24.77 39.69,25.16 39.69,34.85 43.89,39.05 v45.88,39.05 46.36,39.05 48.89,36.51 48.89,20.96 47.86,19.92 v47.55,19.92
RW8  (via drill 0.5)
  Top 0.254: IC3.18 37.19,23.77 33.66,27.3 | 33.66,27.3 IC1.P$11 IC1.11 | v33.66,28.1 33.66,27.3 | IC6.9 38.05,42.18 37.62,41.75 37.62,30.96 36.99,30.32 v35.88,29.05
  Bottom 0.254: 33.81,28.26 v33.66,28.1 34.61,29.05 v35.88,29.05
RW9
  Top 0.254: IC3.17 37.81,24.43 34.92,27.3 34.92,29.84 | 34.92,29.84 IC1.P$12 IC1.12 | IC6.8 37.11,42.82 36.83,42.55 36.83,32.38 34.92,30.48 34.92,29.84
RW10  (via drill 0.5)
  Top 0.254: IC6.7 36.33,43.48 36.04,43.18 36.04,35.24 35.72,34.93 | 35.72,34.93 IC1.P$14 IC1.14 | IC3.16 38.42,25.08 v37.15,26.35 | v35.72,33.66 35.72,34.93
  Bottom 0.254: v37.15,26.35 37.15,32.23 v35.72,33.66
RW11  (via drill 0.5)
  Top 0.254: IC6.6 35.55,44.13 35.24,43.82 35.24,37.94 34.77,37.46 IC1.P$15 IC1.15 | IC3.15 39.52,25.73 38.73,26.51 v38.73,37.46
  Bottom 0.254: v38.73,37.46 IC1.15
RW12  (via drill 0.5)
  Top 0.254: IC6.5 34.61,44.77 34.29,44.45 34.29,40.48 33.81,40.01 IC1.P$16 IC1.16 | IC3.14 40.14,26.38 39.69,26.83 39.69,39.21 v38.89,40.01
  Bottom 0.254: v38.89,40.01 IC1.16
RW13  (via drill 0.5)
  Top 0.254: IC6.4 34,45.43 33.5,44.93 33.5,43.02 33.02,42.55 IC1.P$17 IC1.17 | IC3.13 40.92,27.02 40.64,27.3 40.64,40.48 40,41.12 39.05,41.12 v38.89,41.27
  Bottom 0.254: v38.89,41.27 34.45,41.27 33.1,42.62 29.92,42.62 IC1.17
RW14  (via drill 0.5)
  Top 0.254: IC6.3 45.36,46.07 43.81,47.63 IC1.P$19 IC1.19 | IC3.12 41.7,27.68 41.43,27.94 v41.43,41.12
  Bottom 0.254: v41.43,41.12 41.43,46.99 40.8,47.63 IC1.19
RW15  (via drill 0.5)
  Top 0.254: IC6.2 47.89,46.73 44.45,50.16 IC1.P$20 IC1.20 | IC3.11 42.48,28.33 42.23,28.58 42.23,40.16 42.55,40.48 42.55,40.96 v42.7,41.12
  Bottom 0.254: v42.7,41.12 42.7,48.26 40.8,50.16 IC1.20
VBUS
  Top 0.254: IC1.P$40 IC1.40
VCC  (via drill 0.5)
  Top 0.254: IC4.1 52.92,4.06 | 52.92,4.06 52.86,4.06 | 52.86,4.06 IC4.20 | v39.37,20.96 46.99,20.96 47.62,21.59 47.62,22.23 47.88,22.48 IC3.20 52.92,22.48 | IC2.20 52.91,13.59 | 52.91,13.59 52.92,13.59 | 52.92,13.59 IC2.1 | C2.1 52.92,13.59 | 52.92,22.48 IC3.1 | 52.92,22.48 C1.1 52.92,20.06 52.07,19.21 52.07,15.4 52.92,14.55 52.92,13.59 | R2.1 R1.1 4.23,12.91 5.08,12.07 IC1.P$36 IC1.36 13.34,12.07 22.23,20.96 v22.86,20.96 | C3.1 52.92,4.06 | 52.91,13.59 52.91,14.13 v52.86,14.13 | v52.86,4.05 52.86,4.06
  Bottom 0.254: v22.86,20.96 v39.37,20.96 | v52.86,14.13 v52.86,4.05
VSYS  (via drill 0.5)
  Top 0.254: 53.74,47.38 IC6.1 49.12,47.39 48.02,47.39 46.99,48.42 v46.99,48.9 46.99,51.12 46.36,51.75 26.04,51.75 25.4,51.12 25.4,20.32 24.13,19.05 21.59,19.05 14.61,12.07 14.61,5.08 13.97,4.45 IC1.39 IC1.P$39 D1.C 7.13,3.11 C8.1 | 53.74,47.38 IC6.20 | 53.74,37.85 IC5.1 48.51,37.85 46.99,39.37 v46.99,40.64 | 53.74,37.85 IC5.20 | C4.1 52.94,39.37 53.82,38.5 53.82,37.93 53.74,37.85 | C5.1 52.94,48.9 53.74,48.1 53.74,47.38
  Bottom 0.254: v46.99,40.64 v46.99,48.9

### Text on the board
tNames: ethernet up ^ | Cosmo2ex CART v1.00 | usb down v
bNames: you are going to have a bad day ;) | If you have device plugged into your ST | and you see keyboard and this side of pcb